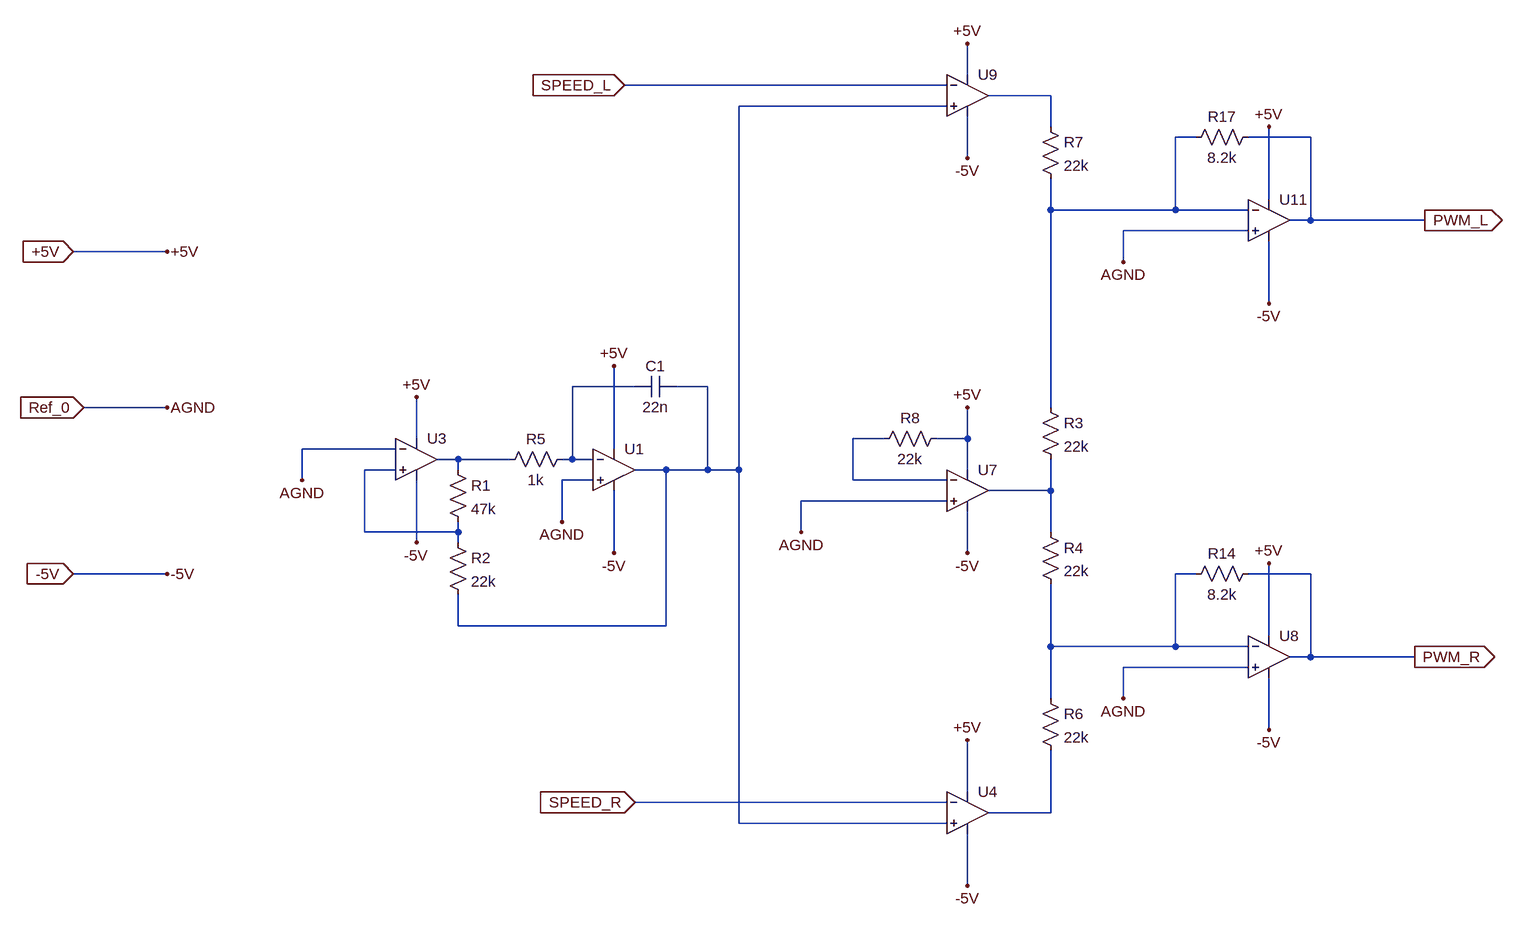
[diagram p0: schematic PWM_Generator.asc]
PWM_Generator.asc, the LTspice schematic file:
Version 4.1
SHEET 1 3972 1512
WIRE 1744 -656 1744 -704
WIRE 1712 -640 1216 -640
WIRE 1872 -624 1776 -624
WIRE 1712 -608 1392 -608
WIRE 1872 -576 1872 -624
WIRE 2096 -560 2064 -560
WIRE 2272 -560 2176 -560
WIRE 1744 -528 1744 -592
WIRE 2208 -464 2208 -576
WIRE 1872 -448 1872 -496
WIRE 2064 -448 2064 -560
WIRE 2064 -448 1872 -448
WIRE 2176 -448 2064 -448
WIRE 2272 -432 2272 -560
WIRE 2272 -432 2240 -432
WIRE 2448 -432 2272 -432
WIRE 2176 -416 1984 -416
WIRE 512 -384 368 -384
WIRE 1984 -368 1984 -416
WIRE 2208 -304 2208 -400
WIRE 1232 -176 1136 -176
WIRE 1344 -176 1296 -176
WIRE 512 -144 384 -144
WIRE 1872 -144 1872 -448
WIRE 896 -96 896 -160
WIRE 1616 -96 1568 -96
WIRE 1744 -96 1744 -144
WIRE 1744 -96 1696 -96
WIRE 864 -80 720 -80
WIRE 1200 -80 1200 -208
WIRE 960 -64 928 -64
WIRE 1040 -64 960 -64
WIRE 1136 -64 1136 -176
WIRE 1136 -64 1120 -64
WIRE 1168 -64 1136 -64
WIRE 864 -48 816 -48
WIRE 960 -48 960 -64
WIRE 1280 -48 1232 -48
WIRE 1344 -48 1344 -176
WIRE 1344 -48 1280 -48
WIRE 1392 -48 1392 -608
WIRE 1392 -48 1344 -48
WIRE 1744 -48 1744 -96
WIRE 720 -32 720 -80
WIRE 1168 -32 1120 -32
WIRE 1568 -32 1568 -96
WIRE 1712 -32 1568 -32
WIRE 1872 -16 1872 -64
WIRE 1872 -16 1776 -16
WIRE 1712 0 1488 0
WIRE 1120 32 1120 -32
WIRE 816 48 816 -48
WIRE 960 48 960 32
WIRE 960 48 816 48
WIRE 1488 48 1488 0
WIRE 1872 48 1872 -16
WIRE 896 64 896 -32
WIRE 960 64 960 48
WIRE 1200 80 1200 -16
WIRE 1744 80 1744 16
WIRE 512 112 368 112
WIRE 2096 112 2064 112
WIRE 2272 112 2176 112
WIRE 960 192 960 144
WIRE 1280 192 1280 -48
WIRE 1280 192 960 192
WIRE 2208 208 2208 96
WIRE 1872 224 1872 128
WIRE 2064 224 2064 112
WIRE 2064 224 1872 224
WIRE 2176 224 2064 224
WIRE 2272 240 2272 112
WIRE 2272 240 2240 240
WIRE 2432 240 2272 240
WIRE 2176 256 1984 256
WIRE 1872 304 1872 224
WIRE 1984 304 1984 256
WIRE 2208 352 2208 272
WIRE 1744 448 1744 368
WIRE 1712 464 1232 464
WIRE 1872 480 1872 384
WIRE 1872 480 1776 480
WIRE 1392 496 1392 -48
WIRE 1712 496 1392 496
WIRE 1744 592 1744 512
FLAG 2448 -432 PWM_L
IOPIN 2448 -432 Out
FLAG 2432 240 PWM_R
IOPIN 2432 240 Out
FLAG 1216 -640 SPEED_L
IOPIN 1216 -640 In
FLAG 1232 464 SPEED_R
IOPIN 1232 464 In
FLAG 1744 -144 +5V
FLAG 1744 80 -5V
FLAG 1744 -528 -5V
FLAG 1744 -704 +5V
FLAG 1744 368 +5V
FLAG 1744 592 -5V
FLAG 2208 -576 +5V
FLAG 2208 -304 -5V
FLAG 2208 96 +5V
FLAG 2208 352 -5V
FLAG 1200 80 -5V
FLAG 1200 -208 +5V
FLAG 896 -160 +5V
FLAG 896 64 -5V
FLAG 368 -384 +5V
IOPIN 368 -384 In
FLAG 368 112 -5V
IOPIN 368 112 In
FLAG 512 -384 +5V
FLAG 512 112 -5V
FLAG 1120 32 AGND
FLAG 720 -32 AGND
FLAG 1488 48 AGND
FLAG 1984 304 AGND
FLAG 1984 -368 AGND
FLAG 384 -144 Ref_0
IOPIN 384 -144 In
FLAG 512 -144 AGND
SYMBOL OpAmps\\UniversalOpAmp2 896 -64 R0
SYMATTR InstName U3
SYMATTR Value2 Avol=200k GBW=3Meg Slew=13Meg
SYMATTR SpiceLine Ilimit=25m Rail=1.5 Vos=3m
SYMATTR SpiceLine2 En=18n Enk=100 In=0.01p Ink=10 Rin=1T
SYMBOL OpAmps\\UniversalOpAmp2 1200 -48 R0
SYMATTR InstName U1
SYMATTR Value2 Avol=200k GBW=3Meg Slew=13Meg
SYMATTR SpiceLine Ilimit=25m Rail=1.5 Vos=3m
SYMATTR SpiceLine2 En=18n Enk=100 In=0.01p Ink=10 Rin=1T
SYMBOL res 1136 -80 R90
WINDOW 0 0 56 VBottom 2
WINDOW 3 32 56 VTop 2
SYMATTR InstName R5
SYMATTR Value 1k
SYMBOL cap 1296 -192 R90
WINDOW 0 0 32 VBottom 2
WINDOW 3 32 32 VTop 2
SYMATTR InstName C1
SYMATTR Value 22n
SYMBOL res 944 -64 R0
SYMATTR InstName R1
SYMATTR Value 47k
SYMBOL res 944 48 R0
SYMATTR InstName R2
SYMATTR Value 22k
SYMBOL OpAmps\\UniversalOpAmp2 1744 480 R0
SYMATTR InstName U4
SYMATTR Value2 Avol=200k GBW=3Meg Slew=13Meg
SYMATTR SpiceLine Ilimit=25m Rail=1.5 Vos=3m
SYMATTR SpiceLine2 En=18n Enk=100 In=0.01p Ink=10 Rin=1T
SYMBOL OpAmps\\UniversalOpAmp2 1744 -16 R0
SYMATTR InstName U7
SYMATTR Value2 Avol=200k GBW=3Meg Slew=13Meg
SYMATTR SpiceLine Ilimit=25m Rail=1.5 Vos=3m
SYMATTR SpiceLine2 En=18n Enk=100 In=0.01p Ink=10 Rin=1T
SYMBOL OpAmps\\UniversalOpAmp2 2208 240 R0
SYMATTR InstName U8
SYMATTR Value2 Avol=200k GBW=3Meg Slew=13Meg
SYMATTR SpiceLine Ilimit=25m Rail=1.5 Vos=3m
SYMATTR SpiceLine2 En=18n Enk=100 In=0.01p Ink=10 Rin=1T
SYMBOL res 2192 96 R90
WINDOW 0 0 56 VBottom 2
WINDOW 3 32 56 VTop 2
SYMATTR InstName R14
SYMATTR Value 8.2k
SYMBOL OpAmps\\UniversalOpAmp2 1744 -624 R0
SYMATTR InstName U9
SYMATTR Value2 Avol=200k GBW=3Meg Slew=13Meg
SYMATTR SpiceLine Ilimit=25m Rail=1.5 Vos=3m
SYMATTR SpiceLine2 En=18n Enk=100 In=0.01p Ink=10 Rin=1T
SYMBOL OpAmps\\UniversalOpAmp2 2208 -432 R0
SYMATTR InstName U11
SYMATTR Value2 Avol=200k GBW=3Meg Slew=13Meg
SYMATTR SpiceLine Ilimit=25m Rail=1.5 Vos=3m
SYMATTR SpiceLine2 En=18n Enk=100 In=0.01p Ink=10 Rin=1T
SYMBOL res 2192 -576 R90
WINDOW 0 0 56 VBottom 2
WINDOW 3 32 56 VTop 2
SYMATTR InstName R17
SYMATTR Value 8.2k
SYMBOL res 1856 -160 R0
SYMATTR InstName R3
SYMATTR Value 22k
SYMBOL res 1856 32 R0
SYMATTR InstName R4
SYMATTR Value 22k
SYMBOL res 1856 288 R0
SYMATTR InstName R6
SYMATTR Value 22k
SYMBOL res 1856 -592 R0
SYMATTR InstName R7
SYMATTR Value 22k
SYMBOL res 1712 -112 R90
WINDOW 0 0 56 VBottom 2
WINDOW 3 32 56 VTop 2
SYMATTR InstName R8
SYMATTR Value 22k

The netlist it stands for:
* PWM_Generator.asc
X§U3 N007 Ref_0 +5V -5V N006 level2 Avol=200k GBW=3Meg Slew=13Meg Ilimit=25m Rail=1.5 Vos=3m En=18n Enk=100 In=0.01p Ink=10 Rin=1T  ; pins In+ In- V+ V- OUT
X§U1 Ref_0 N004 +5V -5V N002 level2 Avol=200k GBW=3Meg Slew=13Meg Ilimit=25m Rail=1.5 Vos=3m En=18n Enk=100 In=0.01p Ink=10 Rin=1T  ; pins In+ In- V+ V- OUT
R5 N004 N006 1k
C1 N002 N004 22n
R1 N006 N007 47k
R2 N007 N002 22k
X§U4 N002 SPEED_R +5V -5V N010 level2 Avol=200k GBW=3Meg Slew=13Meg Ilimit=25m Rail=1.5 Vos=3m En=18n Enk=100 In=0.01p Ink=10 Rin=1T  ; pins In+ In- V+ V- OUT
X§U7 Ref_0 N005 +5V -5V N008 level2 Avol=200k GBW=3Meg Slew=13Meg Ilimit=25m Rail=1.5 Vos=3m En=18n Enk=100 In=0.01p Ink=10 Rin=1T  ; pins In+ In- V+ V- OUT
X§U8 Ref_0 N009 +5V -5V PWM_R level2 Avol=200k GBW=3Meg Slew=13Meg Ilimit=25m Rail=1.5 Vos=3m En=18n Enk=100 In=0.01p Ink=10 Rin=1T  ; pins In+ In- V+ V- OUT
R14 PWM_R N009 8.2k
X§U9 N002 SPEED_L +5V -5V N001 level2 Avol=200k GBW=3Meg Slew=13Meg Ilimit=25m Rail=1.5 Vos=3m En=18n Enk=100 In=0.01p Ink=10 Rin=1T  ; pins In+ In- V+ V- OUT
X§U11 Ref_0 N003 +5V -5V PWM_L level2 Avol=200k GBW=3Meg Slew=13Meg Ilimit=25m Rail=1.5 Vos=3m En=18n Enk=100 In=0.01p Ink=10 Rin=1T  ; pins In+ In- V+ V- OUT
R17 PWM_L N003 8.2k
R3 N003 N008 22k
R4 N008 N009 22k
R6 N009 N010 22k
R7 N001 N003 22k
R8 +5V N005 22k
.lib UniversalOpAmp2.lib
.backanno
.end